# Altium schematic sheet Pulse counter_Sheet.SchDoc
size A4; SheetNumber: 3; SheetTotal: 5
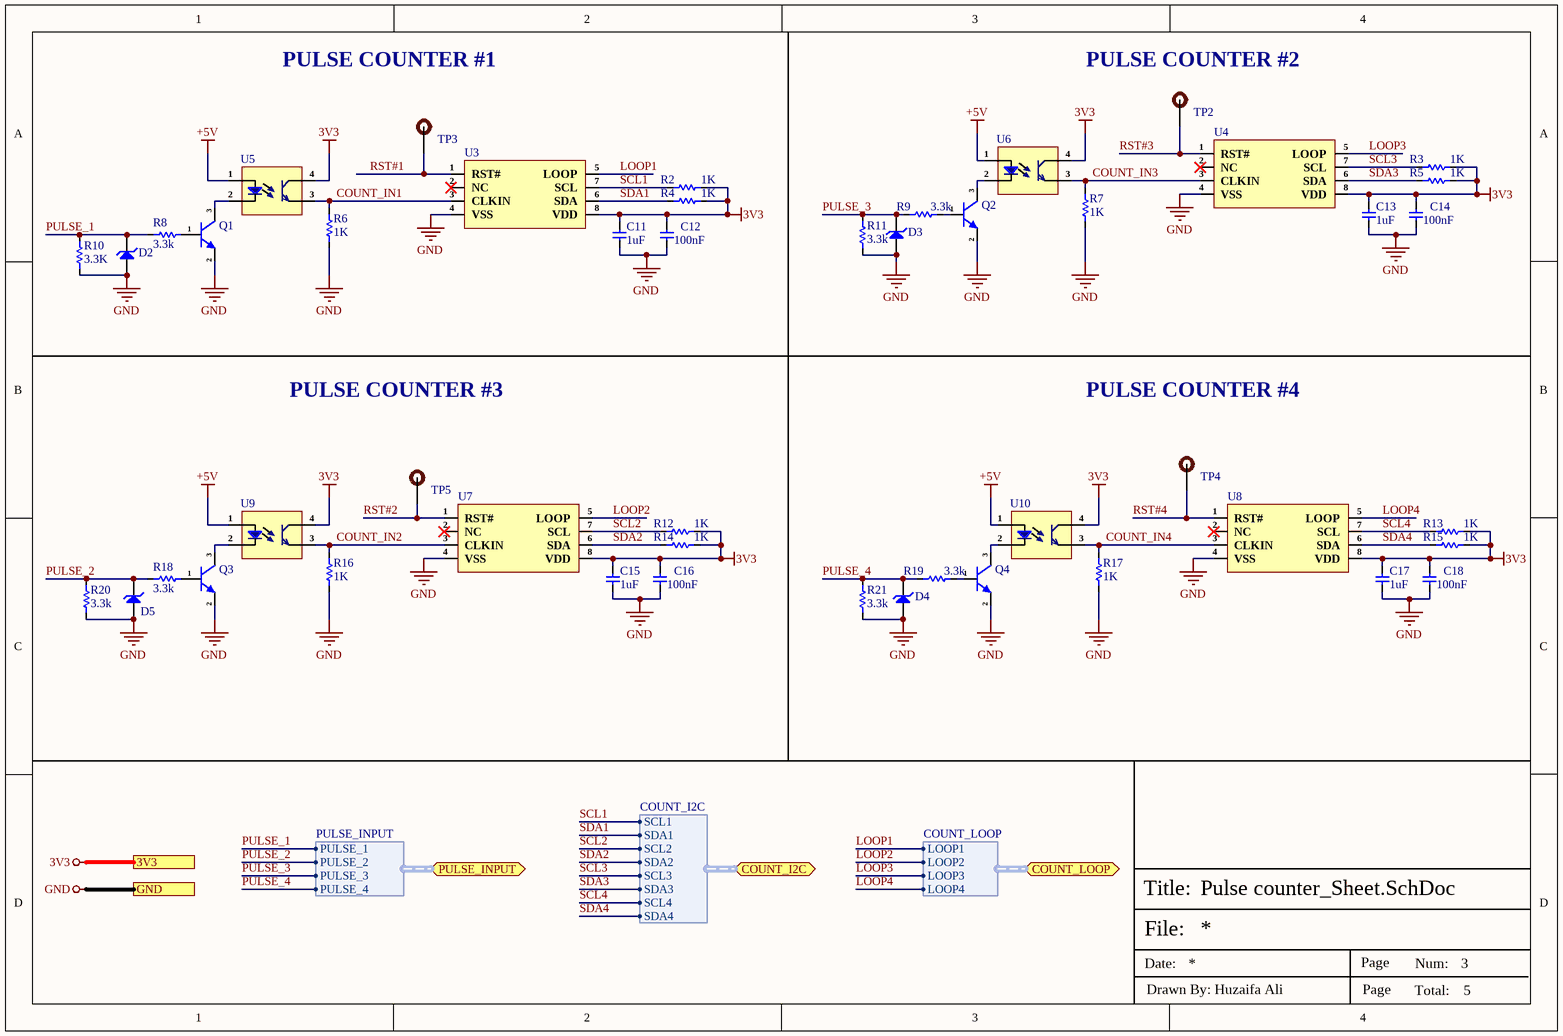
[diagram p0: Pulse counter_Sheet.SchDoc]

## Parts
C11  1uF  [Cap-0402]
C12  100nF  [cap-0402]
C13  1uF  [Cap-0402]
C14  100nF  [cap-0402]
C15  1uF  [Cap-0402]
C16  100nF  [cap-0402]
C17  1uF  [Cap-0402]
C18  100nF  [cap-0402]
D2  AZ4024-01G  [SOD-123]  (value not drawn)
D3  AZ4024-01G  [SOD-123]  (value not drawn)
D4  AZ4024-01G  [SOD-123]  (value not drawn)
D5  AZ4024-01G  [SOD-123]  (value not drawn)
Q1  BC846B(1B)  [SOT-23]  (value not drawn)
Q2  BC846B(1B)  [SOT-23]  (value not drawn)
Q3  BC846B(1B)  [SOT-23]  (value not drawn)
Q4  BC846B(1B)  [SOT-23]  (value not drawn)
R2  1K  [Res-0402]
R3  1K  [Res-0402]
R4  1K  [Res-0402]
R5  1K  [Res-0402]
R6  1K  [Res-0603]
R7  1K  [Res-0603]
R8  3.3k  [Res-0603]
R9  3.3k  [Res-0603]
R10  3.3K  [Res-0603]
R11  3.3k  [Res-0603]
R12  1K  [Res-0402]
R13  1K  [Res-0402]
R14  1K  [Res-0402]
R15  1K  [Res-0402]
R16  1K  [Res-0603]
R17  1K  [Res-0603]
R18  3.3k  [Res-0603]
R19  3.3k  [Res-0603]
R20  3.3k  [Res-0603]
R21  3.3k  [Res-0603]
TP2  TEST POINT 0.5mm Dia  [Test-point - 0.5mm]  (value not drawn)  (no BOM)
TP3  TEST POINT 0.5mm Dia  [Test-point - 0.5mm]  (value not drawn)  (no BOM)
TP4  TEST POINT 0.5mm Dia  [Test-point - 0.5mm]  (value not drawn)  (no BOM)
TP5  TEST POINT 0.5mm Dia  [Test-point - 0.5mm]  (value not drawn)  (no BOM)
U3  (no value)  [8-TMSOP]
U4  (no value)  [8-TMSOP]
U5  (no value)  [SFH617A-2X009T]
U6  (no value)  [SFH617A-2X009T]
U7  (no value)  [8-TMSOP]
U8  (no value)  [8-TMSOP]
U9  (no value)  [SFH617A-2X009T]
U10  (no value)  [SFH617A-2X009T]

## Ports
3V3, COUNT_I2C (bidir, harness COUNT_I2C), COUNT_LOOP (bidir, harness COUNT_LOOP), GND, PULSE_INPUT (bidir, harness PULSE_INPUT)

## Harnesses
COUNT_I2C: SCL1, SDA1, SCL2, SDA2, SCL3, SDA3, SCL4, SDA4
COUNT_LOOP: LOOP1, LOOP2, LOOP3, LOOP4
PULSE_INPUT: PULSE_1, PULSE_2, PULSE_3, PULSE_4

## Nets
3V3: C11.2 C12.2 C13.2 C14.2 C15.2 C16.2 C17.2 C18.2 R2.2 R3.2 R4.2 R5.2 R12.2 R13.2 R14.2 R15.2 U3.8(VDD) U4.8(VDD) U5.4(C) U6.4(C) U7.8(VDD) U8.8(VDD) U9.4(C) U10.4(C) ; port 3V3
+5V: U5.1(An) U6.1(An) U9.1(An) U10.1(An)
GND: C11.1 C12.1 C13.1 C14.1 C15.1 C16.1 C17.1 C18.1 D2.1(A) D3.1(A) D4.1(A) D5.1(A) Q1.2(E) Q2.2(E) Q3.2(E) Q4.2(E) R6.2 R7.2 R10.1 R11.1 R16.2 R17.2 R20.1 R21.1 U3.4(VSS) U4.4(VSS) U7.4(VSS) U8.4(VSS) ; port GND
COUNT_IN1: R6.1 U3.3(CLKIN) U5.3(E)
COUNT_IN2: R16.1 U7.3(CLKIN) U9.3(E)
COUNT_IN3: R7.1 U4.3(CLKIN) U6.3(E)
COUNT_IN4: R17.1 U8.3(CLKIN) U10.3(E)
LOOP1: U3.5(LOOP) ; port COUNT_LOOP.LOOP1
LOOP2: U7.5(LOOP) ; port COUNT_LOOP.LOOP2
LOOP3: U4.5(LOOP) ; port COUNT_LOOP.LOOP3
LOOP4: U8.5(LOOP) ; port COUNT_LOOP.LOOP4
PULSE_1: D2.2(K) R8.1 R10.2 ; port PULSE_INPUT.PULSE_1
PULSE_2: D5.2(K) R18.1 R20.2 ; port PULSE_INPUT.PULSE_2
PULSE_3: D3.2(K) R9.1 R11.2 ; port PULSE_INPUT.PULSE_3
PULSE_4: D4.2(K) R19.1 R21.2 ; port PULSE_INPUT.PULSE_4
RST#1: TP3.1 U3.1(RST#)
RST#2: TP5.1 U7.1(RST#)
RST#3: TP2.1 U4.1(RST#)
RST#4: TP4.1 U8.1(RST#)
SCL1: R2.1 U3.7(SCL) ; port COUNT_I2C.SCL1
SCL2: R12.1 U7.7(SCL) ; port COUNT_I2C.SCL2
SCL3: R3.1 U4.7(SCL) ; port COUNT_I2C.SCL3
SCL4: R13.1 U8.7(SCL) ; port COUNT_I2C.SCL4
SDA1: R4.1 U3.6(SDA) ; port COUNT_I2C.SDA1
SDA2: R14.1 U7.6(SDA) ; port COUNT_I2C.SDA2
SDA3: R5.1 U4.6(SDA) ; port COUNT_I2C.SDA3
SDA4: R15.1 U8.6(SDA) ; port COUNT_I2C.SDA4
NetQ1_1: Q1.1(B) R8.2
NetQ1_3: Q1.3(C) U5.2(Ca)
NetQ2_1: Q2.1(B) R9.2
NetQ2_3: Q2.3(C) U6.2(Ca)
NetQ3_1: Q3.1(B) R18.2
NetQ3_3: Q3.3(C) U9.2(Ca)
NetQ4_1: Q4.1(B) R19.2
NetQ4_3: Q4.3(C) U10.2(Ca)

Not connected (* = marked no-connect by the designer): U3 2(NC)*; U4 2(NC)*; U7 2(NC)*; U8 2(NC)*

## Notes on the sheet
- PULSE COUNTER #1
- (near TP2) PULSE COUNTER #2
- PULSE COUNTER #3
- PULSE COUNTER #4
- File:
- Title:
- Date:
- Page
- Num:
- Total:
- Drawn By: Huzaifa Ali

## Library data of the parts
C11 C13 C15 C17 = C1005X5R1V105K050BC: CAP CER 1UF 35V X5R 0402; Manufacturer: TDK; Item Type: Capacitors; Dielectric Material: Ceramic; Material: 4241ConductorMaterial; Tolerance: 10%; Supplier: Digikey; Supplier Part Number: 445-9073-1-ND; Manufacturer Part Number: C1005X5R1V105K050BC; RoHS: Yes; Stock: 682645; Pricing: 1=0.15, 10=0.087, 50=0.061, 100=0.0528, 500=0.03898, 1000=0.03468, 2500=0.03011, 5000=0.02735 (USD); Mounting Technology: Surface Mount; Case/Package: 0402; Case Code (Metric): 1005; Case Code (Imperial): 0402; Min Operating Temperature: -55°C; Max Operating Temperature: 85°C; Value: 1uF; Voltage Rating: 35V; Packaging: Tape and Reel; Dielectric: X5R; Series: C; Length: 1mm; Depth: 0.5mm; Radiation Hardening: No; Reach SVHC Compliant: No; Lead Free: Lead Free; RoHS Compliant: Yes; ComponentLink1URL: https://datasheet.ciiva.com/26834/getdatasheetpartid-750449-26834298.pdf?src-supplier=Verical; ComponentLink1Description: https://datasheet.ciiva.com/26834/getdatasheetpartid-750449-26834298.pdf?src-supplier=Verical; ComponentLink2URL: https://datasheet.ciiva.com/28451/1796654-28451087.pdf?src-supplier=Element14; ComponentLink2Description: https://datasheet.ciiva.com/28451/1796654-28451087.pdf?src-supplier=Element14; ComponentLink3URL: https://datasheet.ciiva.com/22719/1796654-22719533.pdf?src-supplier=Element14; ComponentLink3Description: https://datasheet.ciiva.com/22719/1796654-22719533.pdf?src-supplier=Element14
C12 C14 C16 C18 = C1005X7R1H104KT000F: CAP CER 0.1UF 50V X7R 0402; Manufacturer: TDK; Tolerance: 10%; Voltage: 25V; Item Type: Capacitor; Supplier 1: Avnet; Manufacturer Part Number: C1005X7R1H104KT000F; RoHS: No; Category: Ceramic Capacitors; Dielectric: X7R; Supplier Part Number 1: C1005X7R1H104KT000F; LCSC Part Number: C361198; ComponentLink1Description: LCSC; ComponentLink1URL: https://www.lcsc.com/product-detail/Multilayer-Ceramic-Capacitors-MLCC-SMD-SMT_TDK-C1005X7R1H104KT000F_C361198.html
D2-D5 = AZ4024-01G: 26.7V 24V SOD-123 ESD and Surge Protection (TVS/ESD) ROHS; Manufacturer: AMAZING; Manufacturer Part Number: AZ4024-01G; Package: SOD-123; LCSC Part Number: C5571859; Item Type: (TVS/ESD); ComponentLink1Description: LCSC; ComponentLink1URL: https://www.lcsc.com/product-detail/ESD-and-Surge-Protection-TVS-ESD_AMAZING-AZ4024-01G_C5571859.html
Q1-Q4 = BC846B(1B): 65V 300mW 200@2mA,5V 100mA NPN SOT-23 Bipolar Transistors - BJT ROHS; Manufacturer: ST(Semtech); Manufacturer Part Number: BC846B(1B); Package: SOT-23; LCSC Part Number: C118727; Item Type: Transistor; ComponentLink1Description: LCSC; ComponentLink1URL: https://www.lcsc.com/product-detail/Transistors-NPN-PNP_ST-Semtech-BC846B-1B_C118727.html
R2-R5 R12-R15 = RC0402JR-071KL: RES 1K OHM 5% 1/16W 0402; Manufacturer: Yageo; Resistance: 1kR; Power Rating: 62.5mW; Voltage Rating: 50V; Temperature Coefficient: 100ppm/°C; Max Power Dissipation: 63mW; Item Type: Resistor; Supplier 1: Digi-Key; Manufacturer Part Number: RC0402JR-071KL; RoHS: Yes; Category: Chip SMD Resistors; Stock 1: 452315; Pricing 1: 1=0.10000, 10=0.01300, 100=0.00540, 1000=0.00244, 2500=0.00212, 5000=0.00175 (USD); Case/Package: 0402; Case Code (Imperial): 0402; Case Code (Metric): 1005; Size Code: 0402; Min Operating Temperature: -55°C; Max Operating Temperature: 155°C; Tolerance: 5%; Packaging: Tape and Reel; Package Quantity: 1; Termination: SMD/SMT; Resistor Type: Thick Film; Number of Terminations: 2; Features: Moisture Resistant; Series: RC; Resistance Tolerance: 5%; Construction: Rectangular; Length: 0.039inch; Width: 0.02inch; Height: 0.016inch; Depth: 0.5mm; REACH SVHC: No SVHC; Military Standard: Not; Lead Free: Lead Free; RoHS Compliant: Yes; ComponentLink1URL: https://datasheet.ciiva.com/7983/1018594-7983558.pdf?src-supplier=Element14; ComponentLink1Description: https://datasheet.ciiva.com/7983/1018594-7983558.pdf?src-supplier=Element14; ComponentLink2URL: https://datasheet.ciiva.com/2452/pyu-r-int-thick-7-2452756.pdf?src-supplier=Digi-Key; ComponentLink2Description: https://datasheet.ciiva.com/2452/pyu-r-int-thick-7-2452756.pdf?src-supplier=Digi-Key; ComponentLink3URL: https://datasheet.ciiva.com/2452/pyu-r-int-thick-7-2452757.pdf?src-supplier=Digi-Key; ComponentLink3Description: https://datasheet.ciiva.com/2452/pyu-r-int-thick-7-2452757.pdf?src-supplier=Digi-Key; ComponentLink4URL: https://datasheet.ciiva.com/2452/pyu-r-int-thick-7-2452755.pdf?src-supplier=Digi-Key; ComponentLink4Description: https://datasheet.ciiva.com/2452/pyu-r-int-thick-7-2452755.pdf?src-supplier=Digi-Key; ComponentLink5URL: https://datasheet.ciiva.com/7850/1018594-7850170.pdf?src-supplier=Element14; ComponentLink5Description: https://datasheet.ciiva.com/7850/1018594-7850170.pdf?src-supplier=Element14; ComponentLink6URL: https://datasheet.ciiva.com/7850/1018594-7850171.pdf?src-supplier=Element14; ComponentLink6Description: https://datasheet.ciiva.com/7850/1018594-7850171.pdf?src-supplier=Element14; ComponentLink7URL: https://datasheet.ciiva.com/17081/pyu-rc0402-51-rohs-l-6-r-17081438.pdf?src-supplier=Future+Electronics; ComponentLink7Description: https://datasheet.ciiva.com/17081/pyu-rc0402-51-rohs-l-6-r-17081438.pdf?src-supplier=Future+Electronics; Supplier Part Number 1: 311-1.0KJRCT-ND; LCSC Part Number: C105637
R6 R7 R16 R17 = CRCW06031K00FKEA: RES SMD 1K OHM 1% 1/10W 0603; Manufacturer: Vishay Dale; Item Type: Resistor; Value: 1kR; Voltage Rating: 75V; Temperature Coefficient: 100ppm/°C; Power Rating: 100mW; LCSC Part Number: C844920; ComponentLink2URL: https://datasheet.ciiva.com/11808/0900766b80d98afc-11808625.pdf?src-supplier=Rs; ComponentLink2Description: https://datasheet.ciiva.com/11808/0900766b80d98afc-11808625.pdf?src-supplier=Rs; ComponentLink3URL: https://datasheet.ciiva.com/46441/1720486-46441623.pdf?src-supplier=Element14; ComponentLink3Description: https://datasheet.ciiva.com/46441/1720486-46441623.pdf?src-supplier=Element14; ComponentLink4URL: https://datasheet.ciiva.com/46441/1720486-46441622.pdf?src-supplier=Element14; ComponentLink4Description: https://datasheet.ciiva.com/46441/1720486-46441622.pdf?src-supplier=Element14; ComponentLink5URL: https://datasheet.ciiva.com/26316/fld-crcw-e3-data-en-26316551.pdf?src-supplier=Distrelec; ComponentLink5Description: https://datasheet.ciiva.com/26316/fld-crcw-e3-data-en-26316551.pdf?src-supplier=Distrelec; ComponentLink6URL: https://datasheet.ciiva.com/2465/dcrcwe3-2465536.pdf?src-supplier=Digi-Key; ComponentLink6Description: https://datasheet.ciiva.com/2465/dcrcwe3-2465536.pdf?src-supplier=Digi-Key; ComponentLink7URL: https://datasheet.ciiva.com/2465/dcrcwe3-2465534.pdf?src-supplier=Digi-Key; ComponentLink7Description: https://datasheet.ciiva.com/2465/dcrcwe3-2465534.pdf?src-supplier=Digi-Key; ComponentLink8URL: https://datasheet.ciiva.com/16199/dcrcwe3-16199053.pdf?src-supplier=Future+Electronics; ComponentLink8Description: https://datasheet.ciiva.com/16199/dcrcwe3-16199053.pdf?src-supplier=Future+Electronics; ComponentLink9URL: https://datasheet.ciiva.com/46385/1697337-46385497.pdf?src-supplier=Element14; ComponentLink9Description: https://datasheet.ciiva.com/46385/1697337-46385497.pdf?src-supplier=Element14; ComponentLink10URL: https://datasheet.ciiva.com/2465/dcrcwe3-2465535.pdf?src-supplier=Digi-Key; ComponentLink10Description: https://datasheet.ciiva.com/2465/dcrcwe3-2465535.pdf?src-supplier=Digi-Key; ComponentLink11URL: https://datasheet.ciiva.com/8336/dcrcwe3-8336822.pdf?src-supplier=Avnet; ComponentLink11Description: https://datasheet.ciiva.com/8336/dcrcwe3-8336822.pdf?src-supplier=Avnet; ComponentLink12URL: https://datasheet.ciiva.com/3257/dcrcwe3-3257132.pdf?src-supplier=Avnet; ComponentLink12Description: https://datasheet.ciiva.com/3257/dcrcwe3-3257132.pdf?src-supplier=Avnet; Supplier: Mouser; Supplier Part Number: 71-CRCW0603-1.0K-E3; Manufacturer Part Number: CRCW06031K00FKEA; RoHS: Yes; Category: Chip SMD Resistors; Stock: 1295653; Pricing: 1=0.1, 10=0.017, 50=0.017, 100=0.01, 1000=0.008, 10000=0.004 (USD); Case/Package: 0603; Pins: 2; Contact Plating: Tin; Weight: 7.1E-05oz; Case Code (Metric): 1608; Case Code (Imperial): 0603; Min Operating Temperature: -55°C; Max Operating Temperature: 155°C; Tolerance: 1%; Resistor Type: Thick Film; Packaging: Tape and Reel; Package Quantity: 5000; Number of Terminations: 2; Termination: SMD/SMT; Max Power Dissipation: 100mW; Features: Automotive AEC-Q200; Series: CRCW; Technology: THICK FILM; Resistance Tolerance: 1%; Voltage Rating (DC): 75V; Construction: Rectangular; Length: 1.55mm; Width: 0.85mm; Height: 0.45mm; Depth: 0.85mm; Ratings: AEC-Q200; Radiation Hardening: No; RoHS Compliant: Yes; Reach SVHC Compliant: Unknown; Lead Free: 5697LeadFree; Military Standard: Not; ComponentLink1URL: https://datasheet.ciiva.com/11808/0900766b80d98afc-11808625.pdf?src-supplier=Rs; ComponentLink1Description: https://datasheet.ciiva.com/11808/0900766b80d98afc-11808625.pdf?src-supplier=Rs; ComponentLink13URL: https://datasheet.ciiva.com/2465/dcrcwe3-2465535.pdf?src-supplier=Digikey; ComponentLink13Description: https://datasheet.ciiva.com/2465/dcrcwe3-2465535.pdf?src-supplier=Digikey; ComponentLink14URL: https://datasheet.ciiva.com/2465/dcrcwe3-2465536.pdf?src-supplier=Digikey; ComponentLink14Description: https://datasheet.ciiva.com/2465/dcrcwe3-2465536.pdf?src-supplier=Digikey; ComponentLink15URL: https://datasheet.ciiva.com/2465/dcrcwe3-2465534.pdf?src-supplier=Digikey; ComponentLink15Description: https://datasheet.ciiva.com/2465/dcrcwe3-2465534.pdf?src-supplier=Digikey
R8-R11 R18-R21 = SR0603JR-7T3K3L: 250mW Thick Film Resistors 75V ±100ppm/℃ ±5% 3.3kΩ 0603 Chip Resistor - Surface Mount ROHS; Manufacturer: Yageo; Supplier: Future Electronics; LCSC Part Number: C873727; Manufacturer Part Number: SR0603JR-7T3K3L; RoHS: Yes; Item Type: Resistors; Stock: 10000; Pricing: 5000=0.0081, 15000=0.0078, 25000=0.0077, 100000=0.0074, 150000=0.0073 (USD); ComponentLink1Description: LCSC; ComponentLink1URL: https://www.lcsc.com/product-detail/Chip-Resistor-Surface-Mount_YAGEO-SR0603JR-7T3K3L_C873727.html
TP2-TP5 = TEST POINT 0.5mm Dia: Test Point ON; Item Type: Test Point; Manufacturer Part Number: TEST POINT 0.5mm Dia
U3 U4 U7 U8 = S-35770E01I-K8T2U: IC OSC 2-WIRE TIMER 1MHZ 8TMSOP; Manufacturer: ABLIC; Supplier: Digikey; LCSC Part Number: C2666930; Manufacturer Part Number: S-35770E01I-K8T2U; RoHS: Yes; Item Type: IC; Stock: 2912; Pricing: 1=7.55, 10=5.036, 25=4.3812, 100=3.6411, 250=3.27772, 500=3.13 (USD)
U5 U6 U9 U10 = SFH617A-2X009T: OPTOISOLATOR 5.3KV TRANS 4SMD; Manufacturer: Vishay; Item Type: IC; Supplier: Arrow Electronics; LCSC Part Number: C5334420; Manufacturer Part Number: SFH617A-2X009T; RoHS: Yes; Stock: 871; Pricing: 1=0.3234, 10=0.3216, 25=0.3197, 100=0.3179, 250=0.3161, 500=0.3142 (USD); ComponentLink1URL: https://datasheet.ciiva.com/18616/options-18616575.pdf?src-supplier=Digikey; ComponentLink1Description: https://datasheet.ciiva.com/18616/options-18616575.pdf?src-supplier=Digikey